# Altium schematic sheet Relay Board.SchDoc
size A3; Organization: South Bay Circuits; Address1: 99 N. McKemy Avenue; Address2: Chandler, Arizona 85226; Revision: A; SheetNumber: 1; SheetTotal: 1
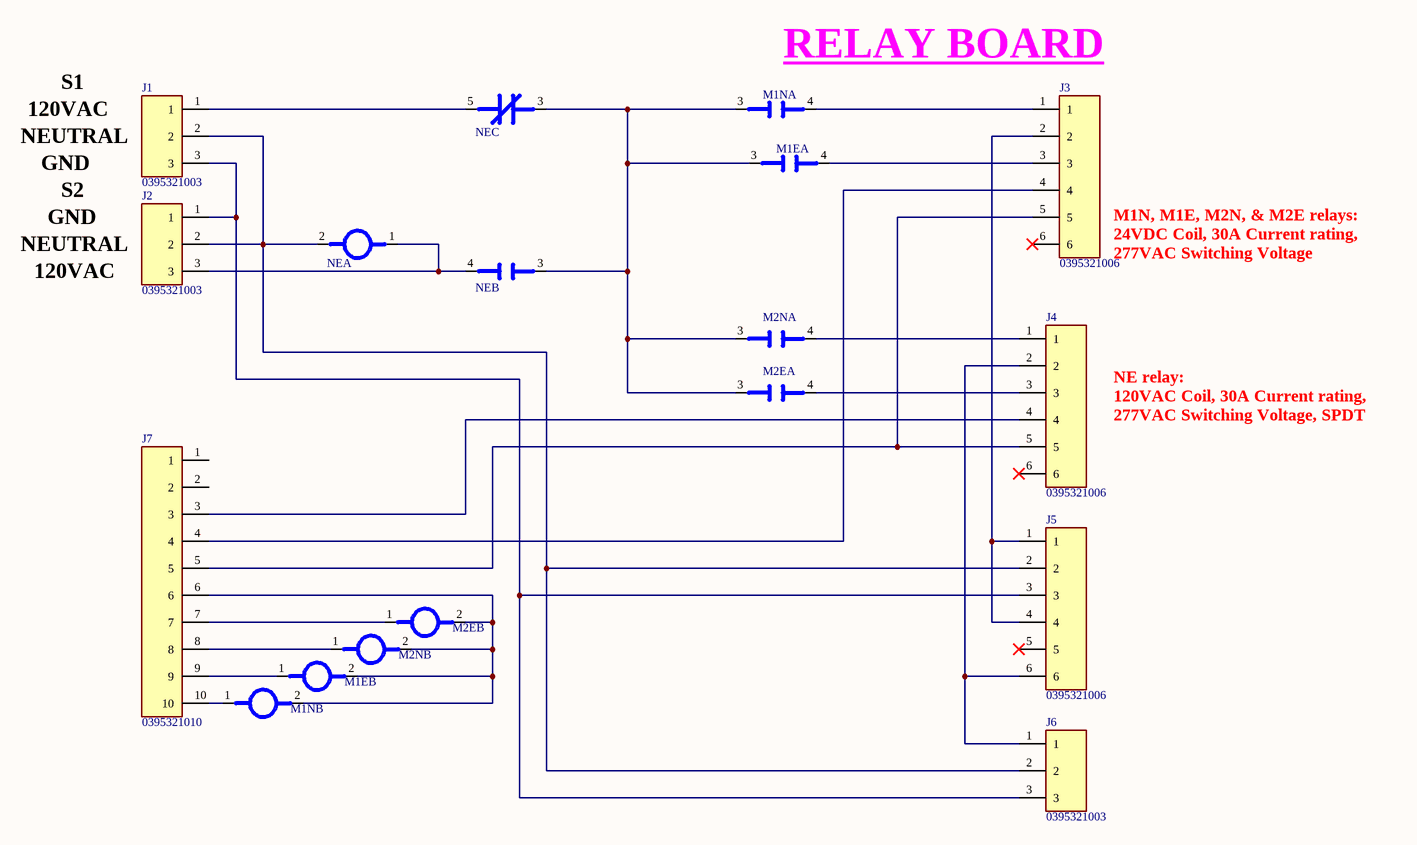
[diagram p0: Relay Board.SchDoc]

## Parts
J1  0395321003  [HDR1X3_MOLEX_TERMINAL]
J2  0395321003  [HDR1X3_MOLEX_TERMINAL]
J3  0395321006  [HDR1X6_MOLEX_TERMINAL]
J4  0395321006  [HDR1X6_MOLEX_TERMINAL]
J5  0395321006  [HDR1X6_MOLEX_TERMINAL]
J6  0395321003  [HDR1X3_MOLEX_TERMINAL]
J7  0395321010  [HDR1X10_MOLEX_TERMINAL]
M1E  G6QE-1A DC24  [RELAY_G6QE-1A_OMR]  (value not drawn)  (parts A,B of 2)
M1N  G6QE-1A DC24  [RELAY_G6QE-1A_OMR]  (value not drawn)  (parts A,B of 2)
M2E  G6QE-1A DC24  [RELAY_G6QE-1A_OMR]  (value not drawn)  (parts A,B of 2)
M2N  G6QE-1A DC24  [RELAY_G6QE-1A_OMR]  (value not drawn)  (parts A,B of 2)
NE  J115F21C120VACS  [RELAY_J115F2]  (value not drawn)  (parts A,B,C of 3)

## Nets
NetJ1_1: J1.1 NE.5(NC)
NetJ1_2: J1.2 J2.2 J5.2 J6.2 NE.2(C2)
NetJ1_3: J1.3 J2.1 J5.3 J6.3
NetJ2_3: J2.3 NE.1(C1) NE.4(NO)
NetJ3_1: J3.1 M1N.4
NetJ3_2: J3.2 J5.1 J5.4
NetJ3_3: J3.3 M1E.4
NetJ3_4: J3.4 J7.4
NetJ3_5: J3.5 J4.5 J7.5
NetJ4_1: J4.1 M2N.4
NetJ4_2: J4.2 J5.6 J6.1
NetJ4_3: J4.3 M2E.4
NetJ4_4: J4.4 J7.3
NetJ7_6: J7.6 M1E.2 M1N.2 M2E.2 M2N.2
NetJ7_7: J7.7 M2E.1
NetJ7_8: J7.8 M2N.1
NetJ7_9: J7.9 M1E.1
NetJ7_10: J7.10 M1N.1
NetM1E_3: M1E.3 M1N.3 M2E.3 M2N.3 NE.3(COM)

Not connected (* = marked no-connect by the designer): J3 6*; J4 6*; J5 5*; J7 1 2

## Notes on the sheet
- RELAY BOARD
- NEUTRAL
- 120VAC
- S1
- GND
- S2
- M1N, M1E, M2N, & M2E relays:
  24VDC Coil, 30A Current rating, 277VAC Switching Voltage
- NE relay:
  120VAC Coil, 30A Current rating, 277VAC Switching Voltage, SPDT
- Title
- Size:
- Date:
- A4
- Number:
- Time:
- Revision:
- Sheet
- of
- File:

## Library data of the parts
J1 J2 J6 = MOLEX_0395321003: TERM BLOCK HDR 3POS 90DEG 5.08MM; Manufacturer: Molex; Manufacturer Part Number: 0395321003; Supplier Part Number 1: WM7846-ND; Package: None; Supplier 1: Digi-Key; Value: 0395321003
J3-J5 = MOLEX_0395321006: TERM BLOCK HDR 6POS 90DEG 5.08MM; Manufacturer: Molex; Manufacturer Part Number: 0395321006; Supplier Part Number 1: 900-0395321006-ND; Package: None; Supplier 1: Digi-Key; Value: 0395321006
J7 = MOLEX_0395321010: TERM BLOCK HDR 10POS 5.08MM; Manufacturer: Molex; Manufacturer Part Number: 0395321010; Supplier Part Number 1: WM7851-ND; Package: None; Supplier 1: Digi-Key; Value: 0395321010
M1E M1N M2E M2N = G6QE-1A DC24: RELAY PWR PCB SPST-NO 32A 24VDC; Manufacturer: Omron; Copyright: Copyright (C) 2022 Ultra Librarian. All rights reserved.; Manufacturer Part Number: G6QE-1A DC24; Supplier Part Number 1: 653-G6QE-1ADC24; Supplier 1: Mouser; Type: DEV
NE = J115F21C120VACS: RELAY UL & TUV GEN PURP SPDT 40A; Manufacturer: CIT Relay and Switch; Manufacturer Part Number: J115F21C120VACS; Supplier Part Number 1: 2449-J115F21C120VACS-ND; Supplier 1: Digi-Key; Type: DEV